# Altium schematic sheet Sheet1.SchDoc
size C
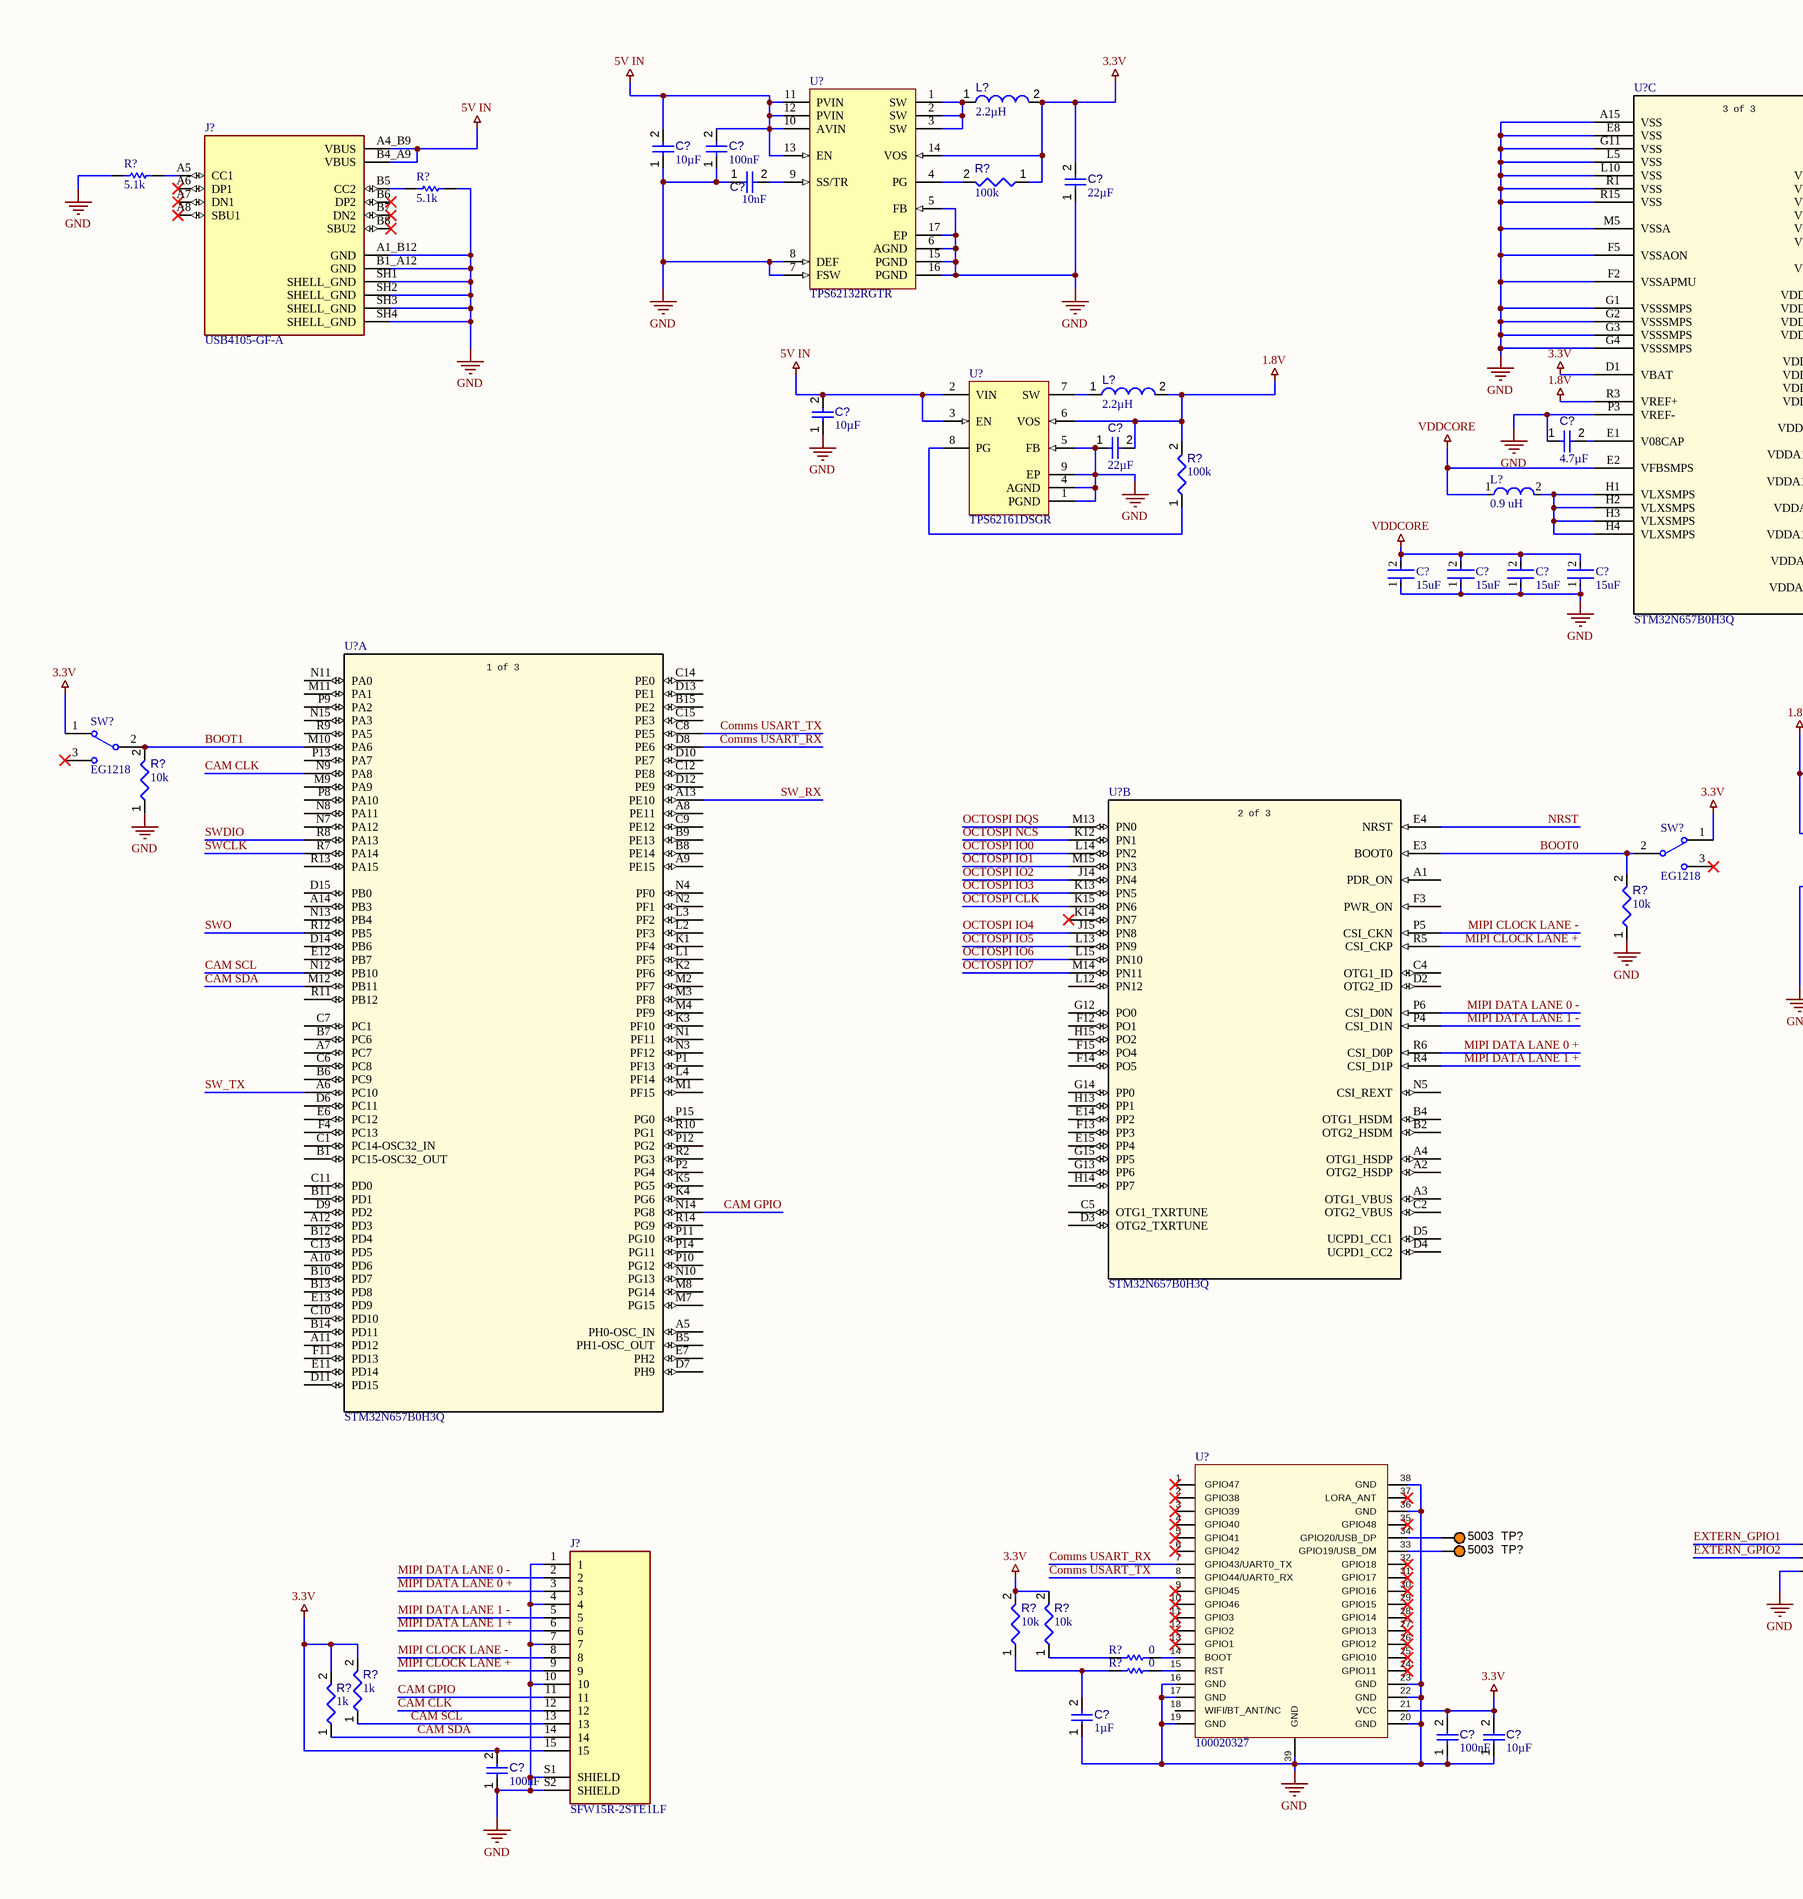
[diagram p0: Sheet1.SchDoc, left]
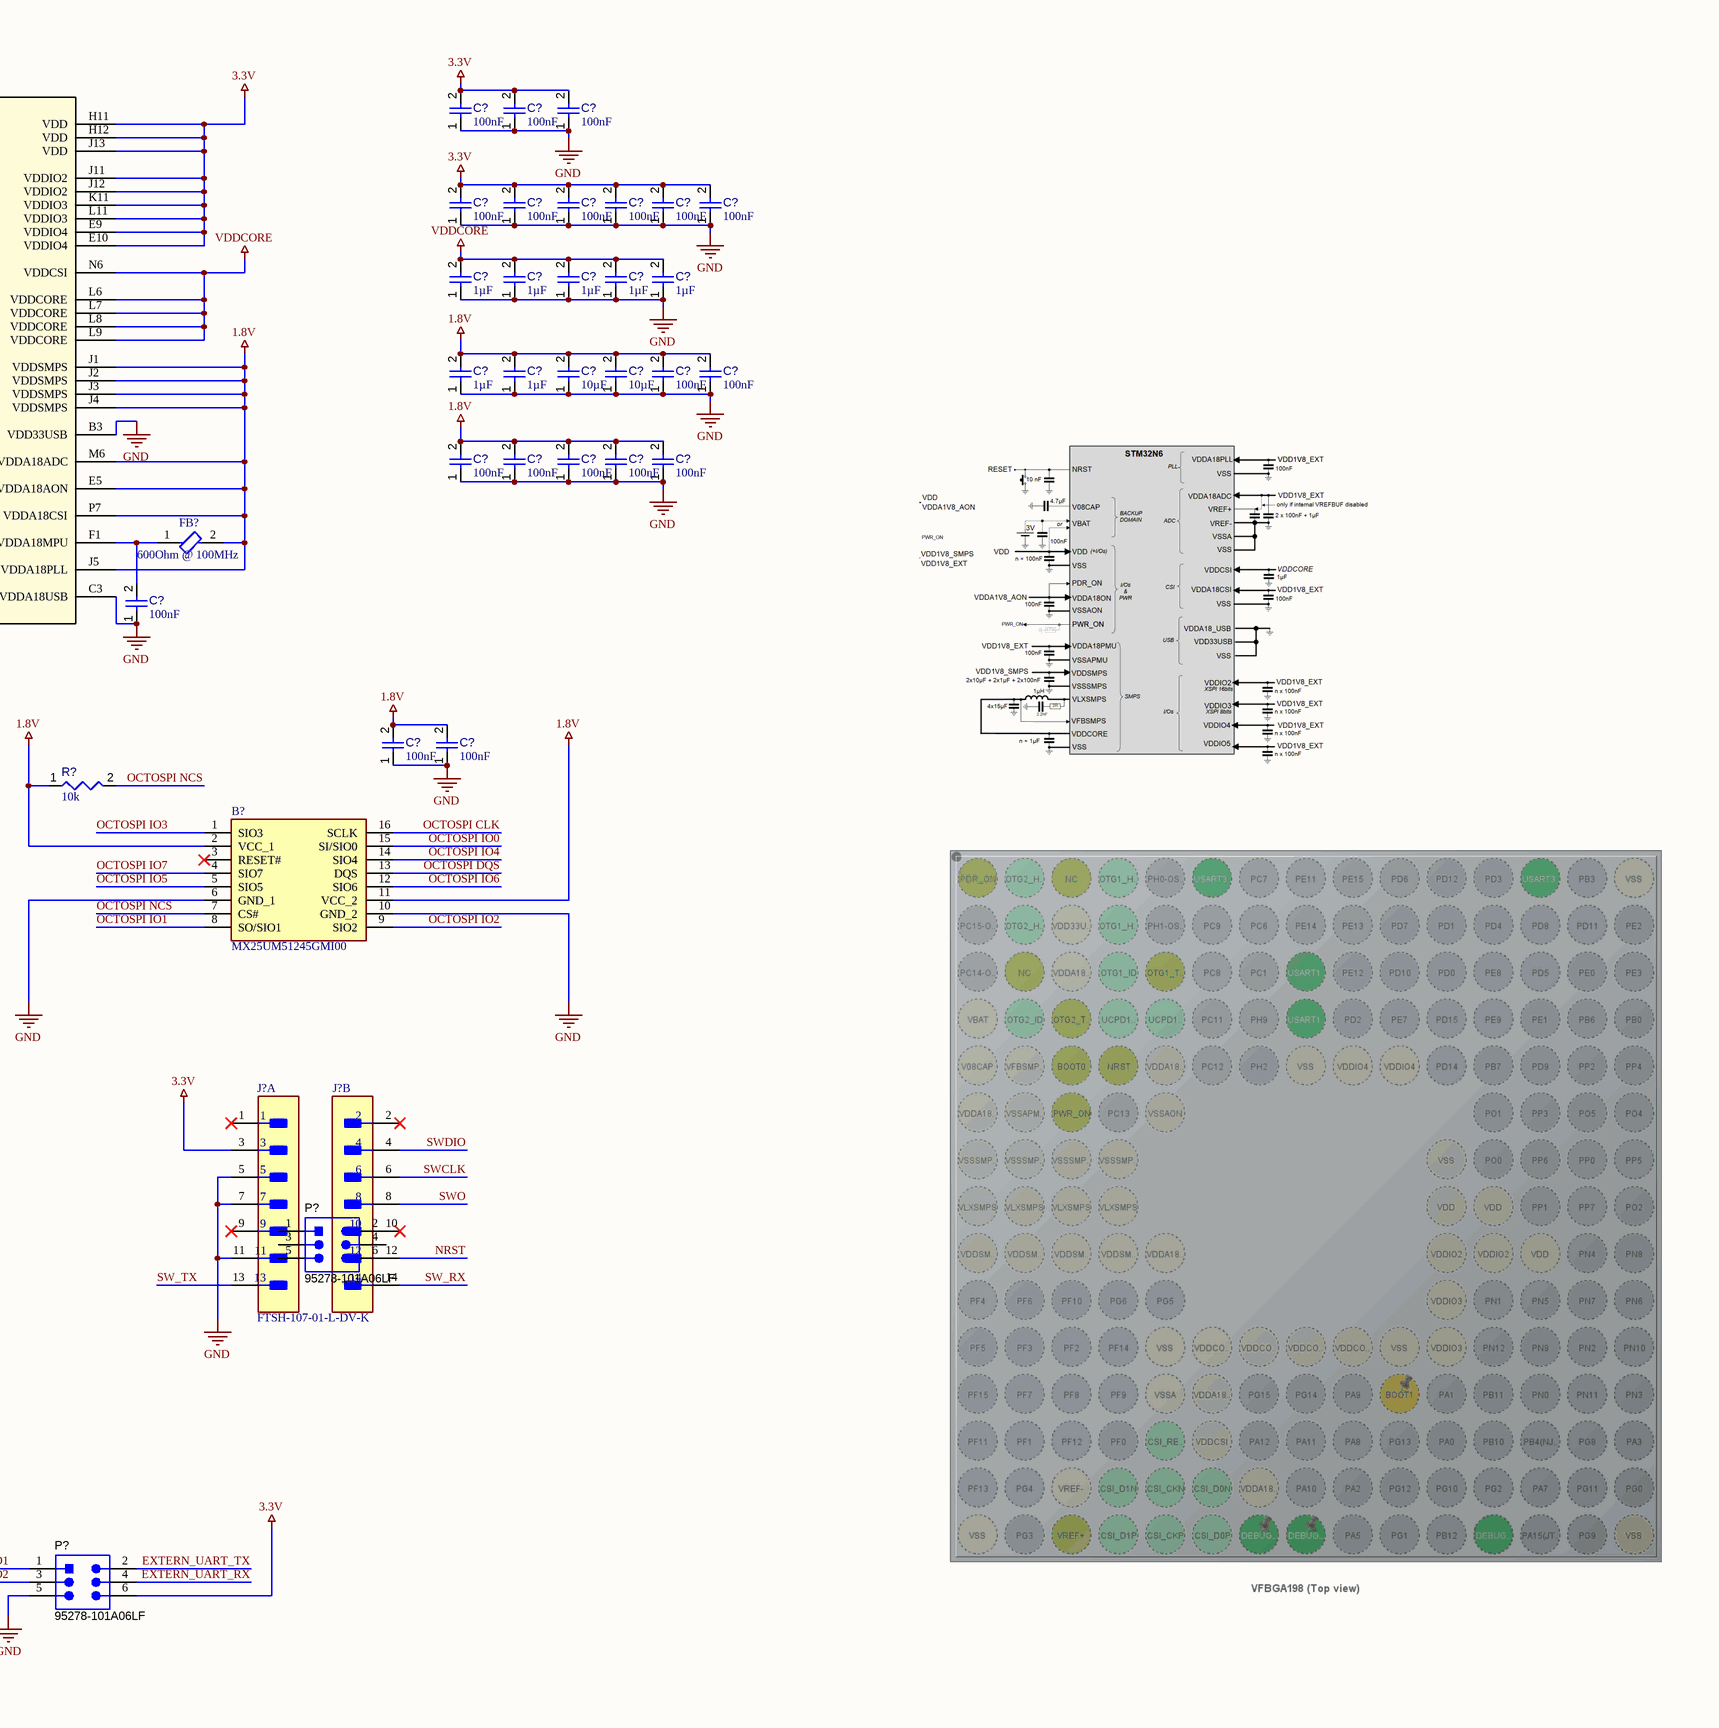
[diagram p1: Sheet1.SchDoc, right]

## Parts
(Parts that share a designator on the sheet are numbered #1, #2 ... from top to bottom, then left to right.)
B?  MX25UM51245GMI00  [MX25UM51245GMI00-Footprint-1]
C?#1  value 100nF  [CAPC1608X90X40NL10T20]  (hidden comment: Capacitor 100 nF +/-10% 50 V 0603)
C?#2  value 100nF  [CAPC1608X90X40NL10T20]  (hidden comment: Capacitor 100 nF +/-10% 50 V 0603)
C?#3  value 100nF  [CAPC1608X90X40NL10T20]  (hidden comment: Capacitor 100 nF +/-10% 50 V 0603)
C?#4  value 10µF  [CAPC0603(1608)100_L]  (hidden comment: Capacitor 10µF +/-20% 10V 0603)
C?#5  value 100nF  [CAPC1608X90X40NL10T20]  (hidden comment: Capacitor 100 nF +/-10% 50 V 0603)
C?#6  value 10nF  [CAPC0402(1005)60_L]  (hidden comment: Capacitor 10nF +/-20% 50V 0402)
C?#7  value 22µF  [CAPC0805(2012)145_L]  (hidden comment: Capacitor 22µF +/-40% 16V 0805)
C?#8  value 100nF  [CAPC1608X90X40NL10T20]  (hidden comment: Capacitor 100 nF +/-10% 50 V 0603)
C?#9  value 100nF  [CAPC1608X90X40NL10T20]  (hidden comment: Capacitor 100 nF +/-10% 50 V 0603)
C?#10  value 100nF  [CAPC1608X90X40NL10T20]  (hidden comment: Capacitor 100 nF +/-10% 50 V 0603)
C?#11  value 100nF  [CAPC1608X90X40NL10T20]  (hidden comment: Capacitor 100 nF +/-10% 50 V 0603)
C?#12  value 100nF  [CAPC1608X90X40NL10T20]  (hidden comment: Capacitor 100 nF +/-10% 50 V 0603)
C?#13  value 100nF  [CAPC1608X90X40NL10T20]  (hidden comment: Capacitor 100 nF +/-10% 50 V 0603)
C?#14  value 1µF  [CAPC1608X90X35ML15T15]  (hidden comment: Capacitor 1uF +/- 10% 16V 0603)
C?#15  value 1µF  [CAPC1608X90X35ML15T15]  (hidden comment: Capacitor 1uF +/- 10% 16V 0603)
C?#16  value 1µF  [CAPC1608X90X35ML15T15]  (hidden comment: Capacitor 1uF +/- 10% 16V 0603)
C?#17  value 1µF  [CAPC1608X90X35ML15T15]  (hidden comment: Capacitor 1uF +/- 10% 16V 0603)
C?#18  value 1µF  [CAPC1608X90X35ML15T15]  (hidden comment: Capacitor 1uF +/- 10% 16V 0603)
C?#19  value 1µF  [CAPC1608X90X35ML15T15]  (hidden comment: Capacitor 1uF +/- 10% 16V 0603)
C?#20  value 1µF  [CAPC1608X90X35ML15T15]  (hidden comment: Capacitor 1uF +/- 10% 16V 0603)
C?#21  value 10µF  [CAPC0603(1608)100_L]  (hidden comment: Capacitor 10µF +/-20% 10V 0603)
C?#22  value 10µF  [CAPC0603(1608)100_L]  (hidden comment: Capacitor 10µF +/-20% 10V 0603)
C?#23  value 100nF  [CAPC1608X90X40NL10T20]  (hidden comment: Capacitor 100 nF +/-10% 50 V 0603)
C?#24  value 100nF  [CAPC1608X90X40NL10T20]  (hidden comment: Capacitor 100 nF +/-10% 50 V 0603)
C?#25  value 10µF  [CAPC0603(1608)100_L]  (hidden comment: Capacitor 10µF +/-20% 10V 0603)
C?#26  value 4.7µF  [CAPC0603(1608)100_L]  (hidden comment: Capacitor 4.7µF +/-20% 10V 0603)
C?#27  value 22µF  [CAPC0805(2012)145_L]  (hidden comment: Capacitor 22µF +/-40% 16V 0805)
C?#28  value 100nF  [CAPC1608X90X40NL10T20]  (hidden comment: Capacitor 100 nF +/-10% 50 V 0603)
C?#29  value 100nF  [CAPC1608X90X40NL10T20]  (hidden comment: Capacitor 100 nF +/-10% 50 V 0603)
C?#30  value 100nF  [CAPC1608X90X40NL10T20]  (hidden comment: Capacitor 100 nF +/-10% 50 V 0603)
C?#31  value 100nF  [CAPC1608X90X40NL10T20]  (hidden comment: Capacitor 100 nF +/-10% 50 V 0603)
C?#32  value 100nF  [CAPC1608X90X40NL10T20]  (hidden comment: Capacitor 100 nF +/-10% 50 V 0603)
C?#33  15uF  [FP-CC0603-DA-MFG]
C?#34  15uF  [FP-CC0603-DA-MFG]
C?#35  15uF  [FP-CC0603-DA-MFG]
C?#36  15uF  [FP-CC0603-DA-MFG]
C?#37  value 100nF  [CAPC1608X90X40NL10T20]  (hidden comment: Capacitor 100 nF +/-10% 50 V 0603)
C?#38  value 100nF  [CAPC1608X90X40NL10T20]  (hidden comment: Capacitor 100 nF +/-10% 50 V 0603)
C?#39  value 100nF  [CAPC1608X90X40NL10T20]  (hidden comment: Capacitor 100 nF +/-10% 50 V 0603)
C?#40  value 1µF  [CAPC1608X90X35ML15T15]  (hidden comment: Capacitor 1uF +/- 10% 16V 0603)
C?#41  value 100nF  [CAPC1608X90X40NL10T20]  (hidden comment: Capacitor 100 nF +/-10% 50 V 0603)
C?#42  value 10µF  [CAPC0603(1608)100_L]  (hidden comment: Capacitor 10µF +/-20% 10V 0603)
C?#43  value 100nF  [CAPC1608X90X40NL10T20]  (hidden comment: Capacitor 100 nF +/-10% 50 V 0603)
FB?  600Ohm @ 100MHz  [FP-MI0603-MFG]
J?#1  USB4105-GF-A  [GCT_USB4105-GF-A]
J?#2  FTSH-107-01-L-DV-K  [FP-FTSH-107-01-L-DV-K-MFG]  (part A of 2)
J?#3  FTSH-107-01-L-DV-K  [FP-FTSH-107-01-L-DV-K-MFG]  (value not drawn)  (part B of 2)
J?#4  SFW15R-2STE1LF  [AMPHENOL_SFW15R-2STE1LF]
L?#1  value 2.2µH  [TDK-VLS252010_V]  (hidden comment: VLS252010HBX-2R2M-1)
L?#2  value 2.2µH  [TDK-VLS252010_V]  (hidden comment: VLS252010HBX-2R2M-1)
L?#3  0.9 uH  [FP-NR6028-MFG]
P?#1  95278-101A06LF  [AMPM-95278-101A06LF_V]
P?#2  95278-101A06LF  [AMPM-95278-101A06LF_V]
R?#1  5.1k  [RESC1608X50X30LL20T20]
R?#2  5.1k  [RESC1608X50X30LL20T20]
R?#3  value 100k  [RESC1608X55X25ML10T15]  (hidden comment: Resistor 100k +/-1% 0603 100 mW)
R?#4  value 100k  [RESC1608X55X25ML10T15]  (hidden comment: Resistor 100k +/-1% 0603 100 mW)
R?#5  value 10k  [RESC1608X55X25ML10T15]  (hidden comment: Resistor 10k +/-1% 0603 100 mW)
R?#6  value 10k  [RESC1608X55X25ML10T15]  (hidden comment: Resistor 10k +/-1% 0603 100 mW)
R?#7  value 10k  [RESC1608X55X25ML10T15]  (hidden comment: Resistor 10k +/-1% 0603 100 mW)
R?#8  value 10k  [RESC1608X55X25ML10T15]  (hidden comment: Resistor 10k +/-1% 0603 100 mW)
R?#9  value 10k  [RESC1608X55X25ML10T15]  (hidden comment: Resistor 10k +/-1% 0603 100 mW)
R?#10  value 0  [RESC1608X55X25ML10T15]  (hidden comment: Resistor 0R +/- 5% 0603 100 mW)
R?#11  value 0  [RESC1608X55X25ML10T15]  (hidden comment: Resistor 0R +/- 5% 0603 100 mW)
R?#12  value 1k  [RESC1608X55X25ML10T15]  (hidden comment: Resistor 1k +/-1% 0603 100 mW)
R?#13  value 1k  [RESC1608X55X25ML10T15]  (hidden comment: Resistor 1k +/-1% 0603 100 mW)
SW?#1  EG1218  [ESWI-EG1218_V]
SW?#2  EG1218  [ESWI-EG1218_V]
TP?#1  5003  [KSTN-5003]
TP?#2  5003  [KSTN-5003]
U?#1  TPS62132RGTR  [RGT0016C_V]
U?#2  STM32N657B0H3Q  [STM32N657B0H3Q-Footprint-1]  (part C of 3)
U?#3  TPS62161DSGR  [DSG0008A_V]
U?#4  STM32N657B0H3Q  [STM32N657B0H3Q-Footprint-1]  (part A of 3)
U?#5  STM32N657B0H3Q  [STM32N657B0H3Q-Footprint-1]  (part B of 3)
U?#6  100020327  [100020327-Footprint-1]

## Nets
1.8V: B?.2(VCC_1) B?.11(VCC_2) C?#19.2 C?#20.2 C?#21.2 C?#22.2 C?#23.2 C?#24.2 C?#27.2 C?#28.2 C?#29.2 C?#30.2 C?#31.2 C?#32.2 C?#38.2 C?#39.2 FB?.2 L?#2.2 R?#4.2 R?#5.1 U?#2.E5(VDDA18AON) U?#2.J1(VDDSMPS) U?#2.J2(VDDSMPS) U?#2.J3(VDDSMPS) U?#2.J4(VDDSMPS) U?#2.J5(VDDA18PLL) U?#2.M6(VDDA18ADC) U?#2.P7(VDDA18CSI) U?#2.R3(VREF+) U?#3.6(VOS)
3.3V: C?#1.2 C?#2.2 C?#3.2 C?#7.2 C?#8.2 C?#9.2 C?#10.2 C?#11.2 C?#12.2 C?#13.2 C?#41.2 C?#42.2 C?#43.2 J?#2.3 J?#4.15 L?#1.2 P?#2.6 R?#3.1 R?#8.2 R?#9.2 R?#12.2 R?#13.2 SW?#1.1 SW?#2.1 U?#1.14(VOS) U?#2.D1(VBAT) U?#2.E9(VDDIO4) U?#2.E10(VDDIO4) U?#2.H11(VDD) U?#2.H12(VDD) U?#2.J11(VDDIO2) U?#2.J12(VDDIO2) U?#2.J13(VDD) U?#2.K11(VDDIO3) U?#2.L11(VDDIO3) U?#6.21(VCC)
5V IN: C?#4.2 C?#5.2 C?#25.2 J?#1.A4_B9(VBUS) J?#1.B4_A9(VBUS) U?#1.10(AVIN) U?#1.11(PVIN) U?#1.12(PVIN) U?#1.13(EN) U?#3.2(VIN) U?#3.3(EN)
GND: B?.6(GND_1) B?.10(GND_2) C?#1.1 C?#2.1 C?#3.1 C?#4.1 C?#5.1 C?#6.1 C?#7.1 C?#8.1 C?#9.1 C?#10.1 C?#11.1 C?#12.1 C?#13.1 C?#14.1 C?#15.1 C?#16.1 C?#17.1 C?#18.1 C?#19.1 C?#20.1 C?#21.1 C?#22.1 C?#23.1 C?#24.1 C?#25.1 C?#26.1 C?#27.1 C?#28.1 C?#29.1 C?#30.1 C?#31.1 C?#32.1 C?#33.1 C?#34.1 C?#35.1 C?#36.1 C?#37.1 C?#38.1 C?#39.1 C?#40.1 C?#41.1 C?#42.1 C?#43.1 J?#1.A1_B12(GND) J?#1.B1_A12(GND) J?#1.SH1(SHELL_GND) J?#1.SH2(SHELL_GND) J?#1.SH3(SHELL_GND) J?#1.SH4(SHELL_GND) J?#2.5 J?#2.7 J?#2.11 J?#4.1 J?#4.4 J?#4.7 J?#4.10 J?#4.S1(SHIELD) J?#4.S2(SHIELD) P?#2.5 R?#1.1 R?#2.2 R?#6.1 R?#7.1 U?#1.5(FB) U?#1.6(AGND) U?#1.7(FSW) U?#1.8(DEF) U?#1.15(PGND) U?#1.16(PGND) U?#1.17(EP) U?#2.A15(VSS) U?#2.B3(VDD33USB) U?#2.C3(VDDA18USB) U?#2.E8(VSS) U?#2.F2(VSSAPMU) U?#2.F5(VSSAON) U?#2.G1(VSSSMPS) U?#2.G2(VSSSMPS) U?#2.G3(VSSSMPS) U?#2.G4(VSSSMPS) U?#2.G11(VSS) U?#2.L5(VSS) U?#2.L10(VSS) U?#2.M5(VSSA) U?#2.P3(VREF-) U?#2.R1(VSS) U?#2.R15(VSS) U?#3.1(PGND) U?#3.4(AGND) U?#3.5(FB) U?#3.9(EP) U?#6.16(GND) U?#6.17(GND) U?#6.19(GND) U?#6.20(GND) U?#6.22(GND) U?#6.23(GND) U?#6.36(GND) U?#6.38(GND) U?#6.39(GND)
VDDCORE: C?#14.2 C?#15.2 C?#16.2 C?#17.2 C?#18.2 C?#33.2 C?#34.2 C?#35.2 C?#36.2 L?#3.1 U?#2.E2(VFBSMPS) U?#2.L6(VDDCORE) U?#2.L7(VDDCORE) U?#2.L8(VDDCORE) U?#2.L9(VDDCORE) U?#2.N6(VDDCSI)
BOOT0: R?#7.2 SW?#2.2(COM) U?#5.E3(BOOT0)
BOOT1: R?#6.2 SW?#1.2(COM) U?#4.M10(PA6)
CAM CLK: J?#4.12 U?#4.N9(PA8)
CAM GPIO: J?#4.11 U?#4.N14(PG8)
CAM SCL: J?#4.13 R?#12.1 U?#4.N12(PB10)
CAM SDA: J?#4.14 R?#13.1 U?#4.M12(PB11)
Comms USART_RX: U?#4.D8(PE6) U?#6.7(GPIO43/UART0_TX)
Comms USART_TX: U?#4.C8(PE5) U?#6.8(GPIO44/UART0_RX)
EXTERN_GPIO1: P?#2.1
EXTERN_GPIO2: P?#2.3
EXTERN_UART_RX: P?#2.4
EXTERN_UART_TX: P?#2.2
MIPI CLOCK LANE +: J?#4.9 U?#5.R5(CSI_CKP)
MIPI CLOCK LANE -: J?#4.8 U?#5.P5(CSI_CKN)
MIPI DATA LANE 0 +: J?#4.3 U?#5.R6(CSI_D0P)
MIPI DATA LANE 0 -: J?#4.2 U?#5.P6(CSI_D0N)
MIPI DATA LANE 1 +: J?#4.6 U?#5.R4(CSI_D1P)
MIPI DATA LANE 1 -: J?#4.5 U?#5.P4(CSI_D1N)
NRST: J?#3.12 U?#5.E4(NRST)
OCTOSPI CLK: B?.16(SCLK) U?#5.K15(PN6)
OCTOSPI DQS: B?.13(DQS) U?#5.M13(PN0)
OCTOSPI IO0: B?.15(SI/SIO0) U?#5.L14(PN2)
OCTOSPI IO1: B?.8(SO/SIO1) U?#5.M15(PN3)
OCTOSPI IO2: B?.9(SIO2) U?#5.J14(PN4)
OCTOSPI IO3: B?.1(SIO3) U?#5.K13(PN5)
OCTOSPI IO4: B?.14(SIO4) U?#5.J15(PN8)
OCTOSPI IO5: B?.5(SIO5) U?#5.L13(PN9)
OCTOSPI IO6: B?.12(SIO6) U?#5.L15(PN10)
OCTOSPI IO7: B?.4(SIO7) U?#5.M14(PN11)
OCTOSPI NCS: B?.7(CS#) R?#5.2 U?#5.K12(PN1)
SW_RX: J?#3.14 U?#4.A13(PE10)
SW_TX: J?#2.13 U?#4.A6(PC10)
SWCLK: J?#3.6 U?#4.R7(PA14)
SWDIO: J?#3.4 U?#4.R8(PA13)
SWO: J?#3.8 U?#4.R12(PB5)
NetC?#6_2: C?#6.2 U?#1.9(SS/TR)
NetC?#26_2: C?#26.2 U?#2.E1(V08CAP)
NetC?#37_2: C?#37.2 FB?.1 U?#2.F1(VDDA18MPU)
NetC?#40_2: C?#40.2 R?#8.1 R?#11.1
NetJ?#1_A5: J?#1.A5(CC1) R?#1.2
NetJ?#1_B5: J?#1.B5(CC2) R?#2.1
NetL?#1_1: L?#1.1 U?#1.1(SW) U?#1.2(SW) U?#1.3(SW)
NetL?#2_1: L?#2.1 U?#3.7(SW)
NetL?#3_2: L?#3.2 U?#2.H1(VLXSMPS) U?#2.H2(VLXSMPS) U?#2.H3(VLXSMPS) U?#2.H4(VLXSMPS)
NetR?#3_2: R?#3.2 U?#1.4(PG)
NetR?#4_1: R?#4.1 U?#3.8(PG)
NetR?#9_1: R?#9.1 R?#10.1
NetR?#10_2: R?#10.2 U?#6.14(BOOT)
NetR?#11_2: R?#11.2 U?#6.15(RST)
NetTP?#1_1: TP?#1.1 U?#6.34(GPIO20/USB_DP)
NetTP?#2_1: TP?#2.1 U?#6.33(GPIO19/USB_DM)

Not connected (* = marked no-connect by the designer): B? 3(RESET#)*; J?#1 A6(DP1)* A7(DN1)* A8(SBU1)* B6(DP2)* B7(DN2)* B8(SBU2)*; J?#2 1* 9*; J?#3 2* 10*; P?#1 1 2 3 4 5 6; SW?#1 3*; SW?#2 3*; U?#4 A5(PH0-OSC_IN) A7(PC7) A8(PE11) A9(PE15) A10(PD6) A11(PD12) A12(PD3) A14(PB3) B1(PC15-OSC32_OUT) B5(PH1-OSC_OUT) B6(PC9) B7(PC6) B8(PE14) B9(PE13) B10(PD7) B11(PD1) B12(PD4) B13(PD8) B14(PD11) B15(PE2) C1(PC14-OSC32_IN) C6(PC8) C7(PC1) C9(PE12) C10(PD10) C11(PD0) C12(PE8) C13(PD5) C14(PE0) C15(PE3) D6(PC11) D7(PH9) D9(PD2) D10(PE7) D11(PD15) D12(PE9) D13(PE1) D14(PB6) D15(PB0) E6(PC12) E7(PH2) E11(PD14) E12(PB7) E13(PD9) F4(PC13) F11(PD13) K1(PF4) K2(PF6) K3(PF10) K4(PG6) K5(PG5) L1(PF5) L2(PF3) L3(PF2) L4(PF14) M1(PF15) M2(PF7) M3(PF8) M4(PF9) M7(PG15) M8(PG14) M9(PA9) M11(PA1) N1(PF11) N2(PF1) N3(PF12) N4(PF0) N7(PA12) N8(PA11) N10(PG13) N11(PA0) N13(PB4) N15(PA3) P1(PF13) P2(PG4) P8(PA10) P9(PA2) P10(PG12) P11(PG10) P12(PG2) P13(PA7) P14(PG11) P15(PG0) R2(PG3) R9(PA5) R10(PG1) R11(PB12) R13(PA15) R14(PG9); U?#5 A1(PDR_ON) A2(OTG2_HSDP) A3(OTG1_VBUS) A4(OTG1_HSDP) B2(OTG2_HSDM) B4(OTG1_HSDM) C2(OTG2_VBUS) C4(OTG1_ID) C5(OTG1_TXRTUNE) D2(OTG2_ID) D3(OTG2_TXRTUNE) D4(UCPD1_CC2) D5(UCPD1_CC1) E14(PP2) E15(PP4) F3(PWR_ON) F12(PO1) F13(PP3) F14(PO5) F15(PO4) G12(PO0) G13(PP6) G14(PP0) G15(PP5) H13(PP1) H14(PP7) H15(PO2) K14(PN7)* L12(PN12) N5(CSI_REXT); U?#6 1(GPIO47)* 2(GPIO38)* 3(GPIO39)* 4(GPIO40)* 5(GPIO41)* 6(GPIO42)* 9(GPIO45)* 10(GPIO46)* 11(GPIO3)* 12(GPIO2)* 13(GPIO1)* 18(WIFI/BT_ANT/NC) 24(GPIO11)* 25(GPIO10)* 26(GPIO12)* 27(GPIO13)* 28(GPIO14)* 29(GPIO15)* 30(GPIO16)* 31(GPIO17)* 32(GPIO18)* 35(GPIO48)* 37(LORA_ANT)*

## Notes on the sheet
- (in symbol CMP-020-00023-1, part C) 3 of 3
- (in symbol CMP-020-00023-2, part A) 1 of 3
- (in symbol CMP-020-00023-2, part B) 2 of 3

## Library data of the parts
B? = CMP-019-00049-2: NOR Flash Memory 512Mb 1.8V Octa I/O Serial 16-Pin SOP; Min Supply Voltage: 1.65V; Max Supply Voltage: 2V; Memory Format: FLASH; Case/Package: SOP; Min Operating Temperature: -40°C; Max Operating Temperature: 85°C
C?#1-C?#3 C?#5 C?#8-C?#13 C?#23 C?#24 C?#28-C?#32 C?#37-C?#39 C?#41 C?#43 = CMP-001-00017-6: Chip Capacitor, 100 nF, +/- 10%, 50 V, 0603 (1608 Metric); Voltage Rating: 50V; Capacitor Type: Ceramic; Tolerance: 10%; Mounting Technology: SM; Max Operating Temperature: 125°C; RoHS Compliant: True; Pins: 2; Case/Package: 0603; Min Operating Temperature: -55°C
C?#4 C?#21 C?#22 C?#25 C?#42 = CMP-001-00075-4: Chip Capacitor, 10µF +/-20%, 10V, 0603, Thickness 1 mm; Tolerance: 10%; Voltage Rating: 10V; Max Operating Temperature: 85°C; Pins: 2; Case/Package: 0603; Mounting Technology: SMT; Min Operating Temperature: -55°C
C?#6 = CMP-001-00069-3: Chip Capacitor, 10nF +/-20%, 50V, 0402, Thickness 0.6 mm; Tolerance: 5%; Max Operating Temperature: 85°C; Pins: 2; Case/Package: 0402; Voltage Rating: 50V; Min Operating Temperature: -55°C; Mounting Technology: SMT
C?#7 C?#27 = CMP-001-00081-4: Chip Capacitor, 22µF +/-40%, 16V, 0805, Thickness 1.45 mm; Tolerance: 5%; Voltage Rating: 16V; Mounting Technology: SMT; Pins: 2; Max Operating Temperature: 85°C; Case/Package: 0805; Min Operating Temperature: -55°C
C?#14-C?#20 C?#40 = CMP-001-00004-6: Chip Capacitor, 1 uF, +/- 10%, 16 V, 0603 (1608 Metric); Capacitor Type: Ceramic; Mounting Technology: SM; RoHS Compliant: True; Min Operating Temperature: -55°C; Case/Package: 0603; Pins: 2; Voltage Rating: 16V; Max Operating Temperature: 125°C; Tolerance: 10%
C?#26 = CMP-001-00076-4: Chip Capacitor, 4.7µF +/-20%, 10V, 0603, Thickness 1 mm; Tolerance: 10%; Mounting Technology: SMT; Case/Package: 0603; Pins: 2; Min Operating Temperature: -55°C; Max Operating Temperature: 85°C; Voltage Rating: 10V
C?#33-C?#36 = CMP-03422-000725-1: CAP CER 0.015UF 50V X7R 0603; Manufacturer Part Number: CC0603KRX7R9BB153; Manufacturer: YAGEO; Tolerance: 0.1; Value: 15 nF; Material: Ceramic; Temperature Coefficient: 15%; Automotive: No; Height: 0.9mm; Device Class L3: Ceramic Capacitors; Category: Cap; Octopart: https://octopart.com/cc0603krx7r9bb153-yageo-42334129; Device Class L2: Capacitors; Digikey Description: CAP CER 0.015UF 50V X7R 0603; Device Class L1: Passive Components; Footprint Url: http://www.yageo.com/exep/pages/download/literatures/UPY-C_GEN_24.pdf; Capacitance: 15 nF; ComponentLink2URL: http://www.yageo.com/documents/recent/UPY-GPHC_X7R_6.3V-to-50V_18.pdf; Temperature: -55°C to +125°C; Voltage: 50 V; Temperature Characteristic: X7R; Voltage Rating: 50 V; Mouser Description: Multilayer Ceramic Capacitors MLCC - SMD/SMT 15nF 50V X7R 10%; ComponentLink2Description: Datasheet; Lead Free: Yes; RoHS: TRUE; Package: CC0603-DA; Temperature Range Low: -55°C; Temperature Range High: +125°C
FB? = CMP-2000-06700-2: FERRITE BEAD 600 OHM 0603 1LN; Manufacturer Part Number: MI0603J601R-10; Manufacturer: Laird; Rms Current: 1000mA; Series Resistance: 0.2Ω; Impedance At Frequency: 600Ω @ 100MHz; Package: MI0603; Device Class L2: EMI / RFI Components; Ipc Land Pattern Name: CAPC16080X80; Category: FBead; Digikey Description: FERRITE BEAD 600 OHM 0603 1LN; Temperature Range High: +125°C; Temperature: -40°C to +125°C; Height: 0.95mm; ComponentLink2Description: Datasheet; Lead Free: Yes; Automotive: No; ComponentLink2URL: https://www.laird.com/sites/default/files/2019-04/MI0603J601R-10_0.pdf; Device Class L3: Ferrite Beads and Chips; Octopart: https://octopart.com/mi0603j601r-10-laird-19252844; Mouser Description: Emi Ferrite Chip Bead, 0603, 1000ma, 600 Ohms @100mhz, Dcr Max 0.20ohm; Temperature Range Low: -40°C; RoHS: TRUE; Device Class L1: Passive Components
J?#1 = CMP-005-000000-1: MF: {'manufacturer': u'GCT'}; Package: None; Source: USB4105-GF-A.SchLib; Price: None; Pin Count: 16; Value: *; Design Item ID: USB4105-GF-A; Availability: Unavailable; MP: USB4105-GF-A; Component Type: Standard
J?#2 J?#3 = CMP-02766-001412-1: CONN HEADER SMD 14POS 1.27MM; Number of Contacts: 14; Gender: Male; Termination: Solder; Lead Free: Lead Free; Depth: 5.84mm; Min Operating Temperature: -55°C; Length: 8.89mm; RoHS Compliant: Yes; Housing Material: Polymer; Housing Color: Black; Max Operating Temperature: 125°C; Number of Rows: 2; Pitch: 1.27mm; Radiation Hardening: No; Orientation: Straight; Packaging: Rail/Tube; Contact Material: Bronze; Contact Plating: Gold
J?#4 = CMP-002-00071-1: 15 Position FFC, FPC Connector Contacts, Top 0.039 (1.00mm) Surface Mount, Right Angle; MF: Amphenol; Check_prices: https://www.snapeda.com/parts/SFW15R-2STE1LF/Amphenol/view-part/?ref=eda; MP: SFW15R-2STE1LF; Case/Package: None; Source: SFW15R-2STE1LF.SchLib; SnapEDA_Link: https://www.snapeda.com/parts/SFW15R-2STE1LF/Amphenol/view-part/?ref=snap; Pins: 17; Component Type: Standard; Value: *; Design Item ID: SFW15R-2STE1LF
L?#1 L?#2 = CMP-006-00020-3: Inductor for Power Circuit, 2.2 uH, +/- 20%, -40 to 105 degC, 2-Pin SMD, RoHS, Tape and Reel; Tolerance: 20%; Mounting Technology: SurfaceMount; Pins: 2
L?#3 = CMP-14484-000457-1: SMD Power Inductors for Automotive Applications 0.9uH ±30% 4.6A 16.9mΩ; DC Resistance (DCR): 16.9mR; Inductance: 900nH; Core Material: Ferrite; Test Frequency: 100kHz; Saturation Current: 6.7A; Self Resonant Frequency: 90MHz; Shielding: Shielded; Max DC Current: 4.6A; Ratings: AEC-Q200; Height - Seated (Max): 0.11inch; Package Quantity: 2000; Height: 2.8mm; Max Operating Temperature: 125°C; Halogen Free: Halogen Free; Width: 0.236inch; Resistor Type: Wirewound; Length: 0.236inch; Tolerance: 30%; Termination: SMD/SMT; Radiation Hardening: No; Packaging: Tape and Reel; Min Operating Temperature: -40°C; Current Rating: 4.6A; Mount: Surface Mount; Case/Package: Nonstandard; RoHS Compliant: Yes; Depth: 6mm
P?#1 P?#2 = CMP-002-00024-2: Male Header, Pitch 2.54 mm, 2 x 3 Position, Height 14.4 mm, RoHS, Tape and Reel; Manufacturer: Amphenol; Package Reference: 95278-101A06LF; Package Description: Male Header, Pitch 2.54 mm, 2 x 3 Position, Height 14.4 mm; RoHS Compliant: Unknown; Case/Package: 95278-101A06LF; Connector Type: Header; Mounting Technology: SM; Gender: Male; Datasheet URL: http://portal.fciconnect.com/Comergent//fci/drawing/95278.pdf; Datasheet Version: Rev. AC, 03/2016
R?#1 R?#2 = CMP-2000-02899-1: Manufacturer: Susumu; Part Number: RG1608N-512-W-T1
R?#3 R?#4 = CMP-009-00023-5: Chip Resistor, 100 KOhm, +/- 1%, 0.1 W, -55 to 155 degC, 0603 (1608 Metric); Voltage Rating: 50V; Power: 100mW; Max Operating Temperature: 155°C; RoHS Compliant: True; Tolerance: 1%; Pins: 2; Case/Package: 0603; Mounting Technology: SM; Min Operating Temperature: -55°C
R?#5-R?#9 = CMP-009-00017-5: Chip Resistor, 10 KOhm, +/- 1%, 01 W, -55 to 155 degC, 0603 (1608 Metric); Voltage Rating: 50V; Power: 100mW; RoHS Compliant: True; Min Operating Temperature: -55°C; Pins: 2; Case/Package: 0603; Mounting Technology: SM; Max Operating Temperature: 155°C; Tolerance: 1%
R?#10 R?#11 = CMP-009-00006-5: Chip Resistor, 0 Ohm, 0.1 W, -55 to 155 degC, 0603 (1608 Metric); Power: 100mW; Voltage Rating: 50V; Max Operating Temperature: 155°C; RoHS Compliant: True; Mounting Technology: SM; Case/Package: 0603; Min Operating Temperature: -55°C; Tolerance: 5%; Pins: 2
R?#12 R?#13 = CMP-009-00014-5: Chip Resistor, 1 KOhm, +/-1%, 0.1 W, -55 to 155 degC, 0603 (1608 Metric); Voltage Rating: 50V; Power: 100mW; Tolerance: 1%; Mounting Technology: SM; Pins: 2; Case/Package: 0603; Min Operating Temperature: -55°C; RoHS Compliant: True; Max Operating Temperature: 155°C
SW?#1 SW?#2 = CMP-011-00006-2: Slide Switch, SPDT, 500 V, -20 to 70 degC, 3-Pin THD, RoHS, Bulk; Manufacturer: E-Switch; Voltage Rating (DC): 30V; Current Rating: 200mA; Operating Force: 250gf; Package Quantity: 1000; Contact Plating: Silver; Max Operating Temperature: 70°C; Min Operating Temperature: -20°C; Contact Material: Copper; Datasheet URL: https://www.e-switch.com/system/asset/product_line/data_sheet/119/EG.pdf; Contact Finish: Silver; Case/Package: EG1218; Voltage Rating (AC): 30V; Datasheet Version: Oct-15; Package Description: 3-Pin Through Hole Device, Body 11.6 x 4 mm, Pitch 2.5 mm; RoHS Compliant: True; Package Reference: EG1218; Manufacturer URL: http://www.e-switch.ch/en/; Throw Configuration: SPDT; Contact Current Rating: 200mA; Mounting Technology: TH; Packaging: Bulk; Pins: 3
TP?#1 TP?#2 = CMP-002-00037-2: Test Point, Orange, Height 4.6 mm, Tail Length 3 mm, 1-Pin THD, RoHS; Manufacturer: Keystone; Colour: Orange; Packaging: Bulk; Package Description: 1-Pin Through Hole Device, Dia 2.54 mm; Pins: 1; Package Reference: 5003; Datasheet Version: Jun-15; Case/Package: 5003; Mounting Technology: TH; Connector Type: TestPoint; Diameter: 2.54mm; Contact Material: Bronze; Datasheet URL: http://keyelco.com/userAssets/file/M65p56.pdf; Manufacturer URL: http://www.keyelco.com/; Package Quantity: 10; Contact Plating: Tin; RoHS Compliant: True
U?#1 = CMP-0323-00152-3: Buck Step Down Regulator with 3 to 17 V Input and 3.3 V Output, -40 to 85 degC, 16-Pin QFN (RGT), Green (RoHS & no Sb/Br); Manufacturer: Texas Instruments; Switch Current Limit(Typ)(A): 4.2; Vout(Max)(V): 3.3; Iout(Max)(A): 3; Regulated Outputs(#): 1; Rating: Catalog; Vin(Max)(V): 17; Synchronous Rectification: TRUE; SubFamily: Step-Down Regulator; Duty Cycle(Max)(%): 100; Iq(Typ)(mA): 0.017; DatasheetVersion: SLVSAG7; ComponentLink3Description: URL Link1; PartNumber: TPS62132RGTR; ComponentLink1Description: Datasheet; Vin(Min)(V): 3; PackageDescription: 16-Pin Plastic Quad Flat No-Lead, 3 x 3 mm Body, 0.5 mm Pitch, 1.7 x 1.7 mm Exposed Pad; Mounting Technology: Surface Mount; Preset Vout(V): 3.3; Code_JEDEC: MO-220; ComponentLink1URL: http://www.ti.com/general/docs/lit/getliterature.tsp?genericPartNumber=TPS62132&fileType=pdf; Vout(Min)(V): 3.3; Eco-Plan: Green (RoHS & no Sb/Br); ComponentLink2URL: http://www.ti.com/litv/pdf/mpqf119g; ComponentLink2Description: Package Specification; PackageReference: RGT0016C; PackageVersion: revH, Oct-2011; Topology: Buck; ComponentLink3URL: Samples URL:http://www.ti.com/product/tps62132#samples
U?#2 = CMP-020-00023-1: MCU 32-bit ARM Cortex M55 RISC 1.8V/2.5V/3.3V 198-Pin VFBGA Tray; Pins: 198
U?#3 = CMP-0323-00308-3: Buck Step Down Regulator with 3 to 17 V Input and 1.8 V Output, -40 to 85 degC, 8-Pin WSON (DSG), Green (RoHS & no Sb/Br); Manufacturer: Texas Instruments; Vout(Min)(V): 1.8; Duty Cycle(Max)(%): 100; Regulated Outputs(#): 1; Iq(Typ)(mA): 0.017; Synchronous Rectification: TRUE; Vin(Min)(V): 3; Vin(Max)(V): 17; SubFamily: Step-Down Regulator; Rating: Catalog; PackageDescription: 8-Pin Plastic Small Outline No-Lead, 2 x 2 x 0.8 mm Body, 0.5 mm Pitch, Exposed Pad; Vout(Max)(V): 1.8; Code_JEDEC: MO-229; ComponentLink2Description: Package Specification; PackageReference: DSG0008A; Switch Current Limit(Typ)(A): 1.8; Topology: Buck; PackageVersion: revB, Oct-2010; ComponentLink1Description: Datasheet; Mounting Technology: Surface Mount; ComponentLink2URL: http://www.ti.com/litv/pdf/mpds308a; Eco-Plan: Green (RoHS & no Sb/Br); ComponentLink3Description: URL Link1; Preset Vout(V): 1.8; ComponentLink1URL: http://www.ti.com/general/docs/lit/getliterature.tsp?genericPartNumber=TPS62161&fileType=pdf; ComponentLink3URL: Samples URL:http://www.ti.com/product/tps62161#samples; PartNumber: TPS62161DSGR; DatasheetVersion: SLVSAM2A; Iout(Max)(A): 1
U?#4 U?#5 = CMP-020-00023-2: MCU 32-bit ARM Cortex M55 RISC 1.8V/2.5V/3.3V 198-Pin VFBGA Tray; Pins: 198
U?#6 = CMP-021-00007-1: WIO-S3 Wireless Module With Ipex